# Altium schematic sheet STPMotorControl_1.SchDoc
size A4; SheetNumber: 2; SheetTotal: 6
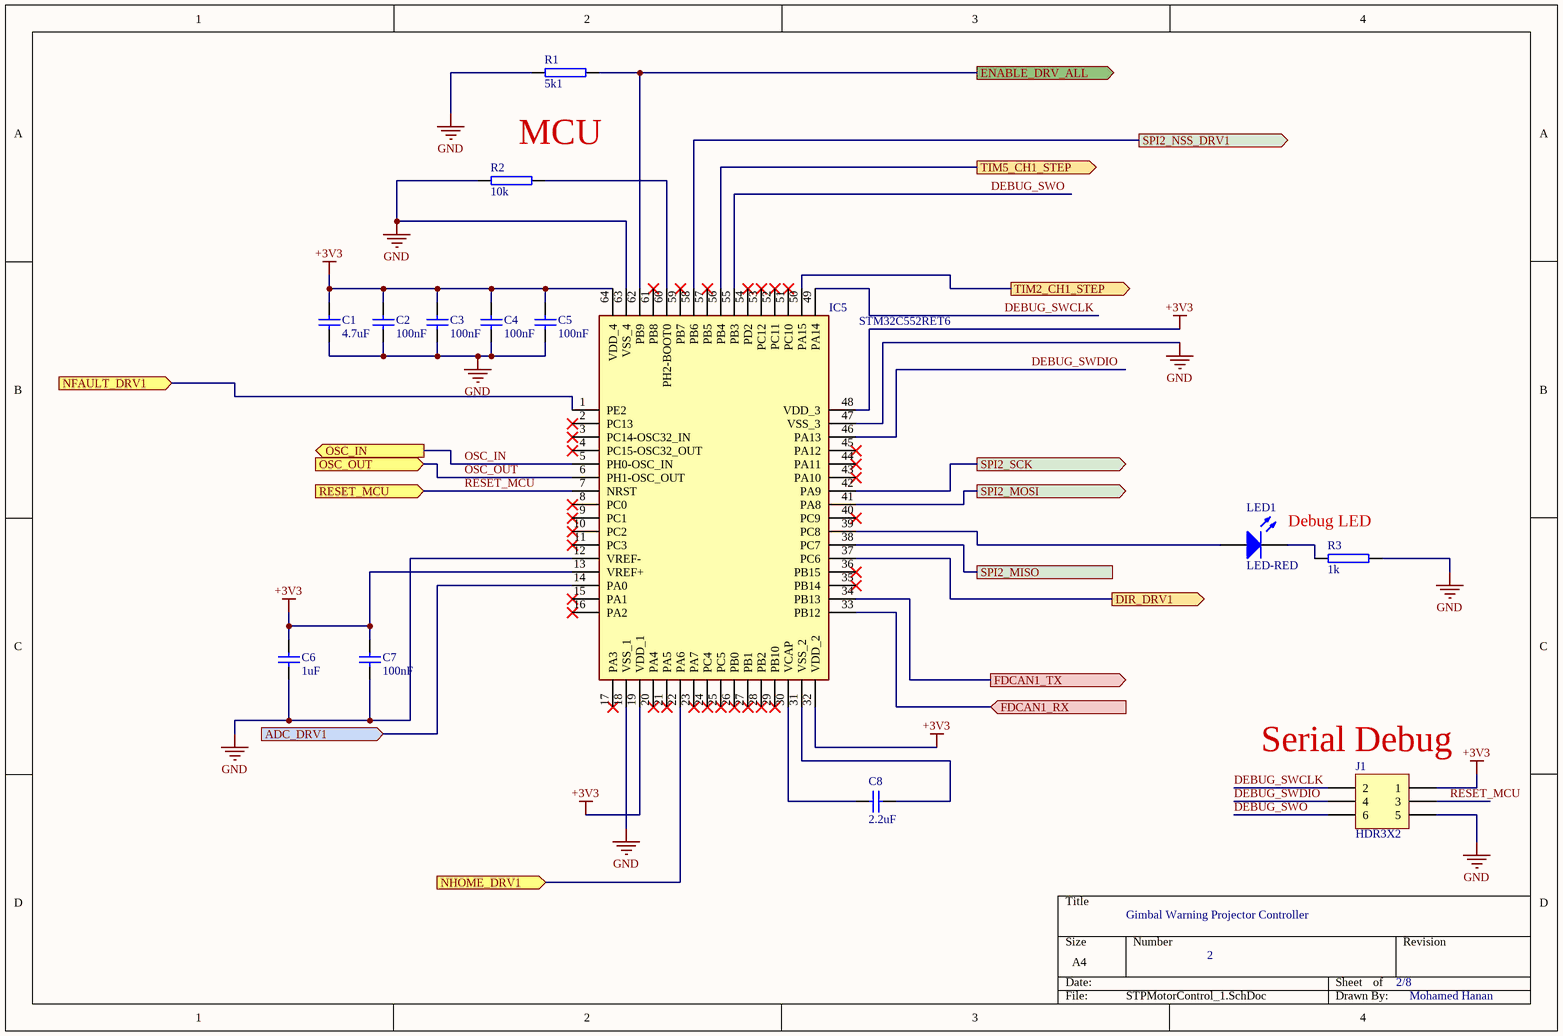
[diagram p0: STPMotorControl_1.SchDoc]

## Parts
C1  4.7uF  [CAP_1206]
C2  100nF  [CAP_0805]
C3  100nF  [CAP_0805]
C4  100nF  [CAP_0805]
C5  100nF  [CAP_0805]
C6  1uF  [CAP_0805]
C7  100nF  [CAP_0805]
C8  2.2uF  [CAP_0805]
IC5  STM32C552RET6  [QFP50P1200X1200X160-64N]
J1  HDR3X2  [HDR2X3_AUT]
LED1  LED-RED  [LED1206R]
R1  5k1  [RES_0805]
R2  10k  [RES_0805]
R3  1k  [RES_1206]

## Ports
ADC_DRV1 (in, see STPMotorConnections[2A], STPMotorControl7_1[1A]), DIR_DRV1 (out, see STPMotorConnections[2C], STPMotorControl4_1[2B]), ENABLE_DRV_ALL (out, see STPMotorConnections[3B]), FDCAN1_RX (in, see STPMotorConnections[3B], STPMotorControl2_1[1B]), FDCAN1_TX (out, see STPMotorConnections[3B], STPMotorControl2_1[2B]), NFAULT_DRV1 (in, see STPMotorConnections[2C], STPMotorControl4_1[2C]), NHOME_DRV1 (in, see STPMotorConnections[3A], STPMotorControl4_1[2C]), OSC_IN (out, see STPMotorConnections[3C], STPMotorControl3_1[1C]), OSC_OUT (in, see STPMotorConnections[3C], STPMotorControl3_1[2B]), RESET_MCU (in, see STPMotorConnections[3C], STPMotorControl3_1[1D]), SPI2_MISO (see STPMotorConnections[3B], STPMotorControl4_1[3C]), SPI2_MOSI (out, see STPMotorConnections[3C], STPMotorControl4_1[3C]), SPI2_NSS_DRV1 (out, see STPMotorConnections[2B], STPMotorControl4_1[2B]), SPI2_SCK (out, see STPMotorConnections[3B], STPMotorControl4_1[3C]), TIM2_CH1_STEP (out, see STPMotorConnections[2B], STPMotorControl4_1[3B]), TIM5_CH1_STEP (out, see STPMotorConnections[2B], STPMotorControl7_1[1B])

## Nets
+3V3: C1.2 C2.2 C3.2 C4.2 C5.2 C6.2 C7.2 IC5.13(VREF+) IC5.19(VDD_1) IC5.32(VDD_2) IC5.48(VDD_3) IC5.64(VDD_4) J1.1
GND: C1.1 C2.1 C3.1 C4.1 C5.1 C6.1 C7.1 IC5.12(VREF-) IC5.18(VSS_1) IC5.47(VSS_3) IC5.63(VSS_4) J1.5 R1.1 R2.1 R3.2
ADC_DRV1: IC5.14(PA0) ; port ADC_DRV1
DEBUG_SWCLK: IC5.49(PA14) J1.2
DEBUG_SWDIO: IC5.46(PA13) J1.4
DEBUG_SWO: IC5.55(PB3) J1.6
DIR_DRV1: IC5.37(PC6) ; port DIR_DRV1
ENABLE_DRV_ALL: IC5.62(PB9) R1.2 ; port ENABLE_DRV_ALL
FDCAN1_RX: IC5.33(PB12) ; port FDCAN1_RX
FDCAN1_TX: IC5.34(PB13) ; port FDCAN1_TX
NFAULT_DRV1: IC5.1(PE2) ; port NFAULT_DRV1
NHOME_DRV1: IC5.22(PA6) ; port NHOME_DRV1
OSC_IN: IC5.5(PH0-OSC_IN) ; port OSC_IN
OSC_OUT: IC5.6(PH1-OSC_OUT) ; port OSC_OUT
RESET_MCU: IC5.7(NRST) J1.3 ; port RESET_MCU
SPI2_MISO: IC5.38(PC7) ; port SPI2_MISO
SPI2_MOSI: IC5.41(PA8) ; port SPI2_MOSI
SPI2_NSS_DRV1: IC5.58(PB6) ; port SPI2_NSS_DRV1
SPI2_SCK: IC5.42(PA9) ; port SPI2_SCK
TIM2_CH1_STEP: IC5.50(PA15) ; port TIM2_CH1_STEP
TIM5_CH1_STEP: IC5.56(PB4) ; port TIM5_CH1_STEP
NetC8_1: C8.1 IC5.30(VCAP)
NetC8_2: C8.2 IC5.31(VSS_2)
NetIC5_39: IC5.39(PC8) LED1.A
NetIC5_60: IC5.60(PH2-BOOT0) R2.2
NetLED1_K: LED1.K R3.1

Not connected (* = marked no-connect by the designer): IC5 2(PC13)* 3(PC14-OSC32_IN)* 4(PC15-OSC32_OUT)* 8(PC0)* 9(PC1)* 10(PC2)* 11(PC3)* 15(PA1)* 16(PA2)* 17(PA3)* 20(PA4)* 21(PA5)* 23(PA7)* 24(PC4)* 25(PC5)* 26(PB0)* 27(PB1)* 28(PB2)* 29(PB10)* 35(PB14)* 36(PB15)* 40(PC9)* 43(PA10)* 44(PA11)* 45(PA12)* 51(PC10)* 52(PC11)* 53(PC12)* 54(PD2)* 57(PB5)* 59(PB7)* 61(PB8)*

## Notes on the sheet
- MCU
- Debug LED
- (near J1) Serial Debug
- Gimbal Warning Projector Controller
- 2
- 2/8
- Mohamed Hanan

## Library data of the parts
C1 = CAPN 1206: Non Polarized Capacitor, SMD, 1206
C2-C8 = CAPN 0805: Non Polarized Capacitor, SMD, 0805
IC5 = STM32C552RET6: Integrated Circuit; Manufacturer_Name: STMicroelectronics; Datasheet Link: https://www.st.com/resource/en/datasheet/stm32c551cc.pdf; Height: 1.6mm; Manufacturer_Part_Number: STM32C552RET6
J1 = HDR3X2: Header, 3-Pin, Dual row, 2.54mm Pitch, Straight; Supplier 1: Farnell; Supplier Part Number 1: 9733574
LED1 = SMD 1206 LED-RED: RED LED, Case 1206; Supplier 1: Farnell; Supplier Part Number 1: 8530017
R1 R2 = Resistor 0805: Resistor, SMD, 0805
R3 = Resistor 1206: Resistor, SMD, 1206